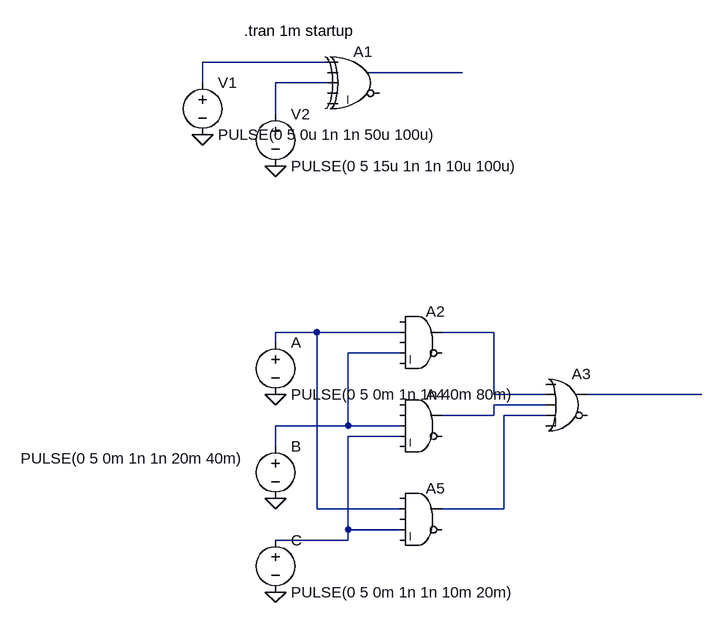
[diagram p0: schematic chemical_tank_pulse.asc]
chemical_tank_pulse.asc, the LTspice schematic file:
Version 4.1
SHEET 1 880 932
WIRE 208 96 16 96
WIRE 416 112 272 112
WIRE 16 128 16 96
WIRE 208 128 128 128
WIRE 128 176 128 128
WIRE 192 512 128 512
WIRE 320 512 192 512
WIRE 464 512 384 512
WIRE 128 528 128 512
WIRE 320 544 240 544
WIRE 464 608 464 512
WIRE 544 608 464 608
WIRE 784 608 608 608
WIRE 544 624 464 624
WIRE 464 640 464 624
WIRE 464 640 384 640
WIRE 544 640 480 640
WIRE 240 656 240 544
WIRE 240 656 128 656
WIRE 320 656 240 656
WIRE 320 672 240 672
WIRE 128 688 128 656
WIRE 192 784 192 512
WIRE 320 784 192 784
WIRE 480 784 480 640
WIRE 480 784 384 784
WIRE 240 816 240 672
WIRE 320 816 240 816
WIRE 240 832 240 816
WIRE 240 832 128 832
FLAG 128 256 0
FLAG 16 208 0
FLAG 128 608 0
FLAG 128 768 0
FLAG 128 912 0
SYMBOL Digital\\xor 256 64 R0
SYMATTR InstName A1
SYMBOL voltage 16 112 R0
WINDOW 123 0 0 Left 0
WINDOW 39 0 0 Left 0
SYMATTR InstName V1
SYMATTR Value PULSE(0 5 0u 1n 1n 50u 100u)
SYMBOL voltage 128 160 R0
WINDOW 123 0 0 Left 0
WINDOW 39 0 0 Left 0
SYMATTR InstName V2
SYMATTR Value PULSE(0 5 15u 1n 1n 10u 100u)
SYMBOL Digital\\and 352 464 R0
WINDOW 3 16 52 Left 2
SYMATTR InstName A2
SYMBOL Digital\\or 576 560 R0
WINDOW 3 -8 36 Left 2
SYMATTR InstName A3
SYMBOL Digital\\and 352 592 R0
WINDOW 3 16 52 Left 2
SYMATTR InstName A4
SYMBOL Digital\\and 352 736 R0
WINDOW 3 16 52 Left 2
SYMATTR InstName A5
SYMBOL voltage 128 512 R0
WINDOW 123 0 0 Left 0
WINDOW 39 0 0 Left 0
SYMATTR InstName A
SYMATTR Value PULSE(0 5 0m 1n 1n 40m 80m)
SYMBOL voltage 128 672 R0
WINDOW 123 0 0 Left 0
WINDOW 39 0 0 Left 0
WINDOW 3 -392 34 Left 2
SYMATTR Value PULSE(0 5 0m 1n 1n 20m 40m)
SYMATTR InstName B
SYMBOL voltage 128 816 R0
WINDOW 123 0 0 Left 0
WINDOW 39 0 0 Left 0
SYMATTR InstName C
SYMATTR Value PULSE(0 5 0m 1n 1n 10m 20m)
TEXT 80 48 Left 2 !.tran 1m startup

The netlist it stands for:
* chemical_tank_pulse.asc
A1 N001 0 N003 0 0 0 N002 0 XOR
V1 N001 0 PULSE(0 5 0u 1n 1n 50u 100u)
V2 N003 0 PULSE(0 5 15u 1n 1n 10u 100u)
A2 0 N004 0 N006 0 0 N005 0 AND
A3 0 N005 N008 N009 0 0 N007 0 OR
A4 0 0 N006 N010 0 0 N008 0 AND
A5 0 N004 0 N010 0 0 N009 0 AND
V§A N004 0 PULSE(0 5 0m 1n 1n 40m 80m)
V§B N006 0 PULSE(0 5 0m 1n 1n 20m 40m)
V§C N010 0 PULSE(0 5 0m 1n 1n 10m 20m)
.tran 1m startup
.backanno
.end